# Altium schematic sheet TLD23313EPXUMA11_TLD23313EPXUMA1.schdoc
size 124 x 99 mm
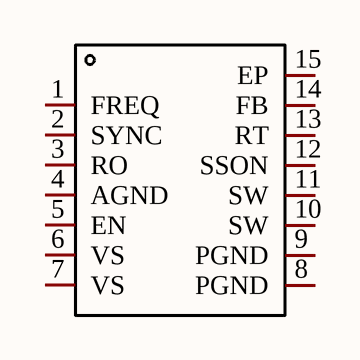
[diagram p0: TLD23313EPXUMA11_TLD23313EPXUMA1.schdoc]

## Parts
U?  TLD23313EPXUMA1  (value not drawn)

## Nets

Not connected (* = marked no-connect by the designer): U? 1(FREQ) 2(SYNC) 3(RO) 4(AGND) 5(EN) 6(VS) 7(VS) 8(PGND) 9(PGND) 10(SW) 11(SW) 12(SSON) 13(RT) 14(FB) 15(EP)

## Library data of the parts
U? = TLD23313EPXUMA1: Manufacturer: Infineon(英飞凌); Add into BOM: yes; Name: TLD23313EPXUMA1; Symbol: TLD23313EPXUMA1; Device: TLD23313EPXUMA1; LCSC Part Name: TLD23313EPXUMA1; Supplier Part: C3034685; Manufacturer Part: TLD23313EPXUMA1; Supplier Footprint: PG-TSDSO-14; JLCPCB Part Class: Extended Part; Datasheet: https://atta.szlcsc.com/upload/public/pdf/source/20220609/3E1B98B62208CAF79E791631086D82DE.pdf; Supplier: LCSC; Convert to PCB: yes